# Altium project Audio-Switch-v2.0.PrjPcb (part 3 of 3)

## Sheet Power-Sheet.SchDoc
size 420 x 297 mm; SheetNumber: 2; SheetTotal: 5
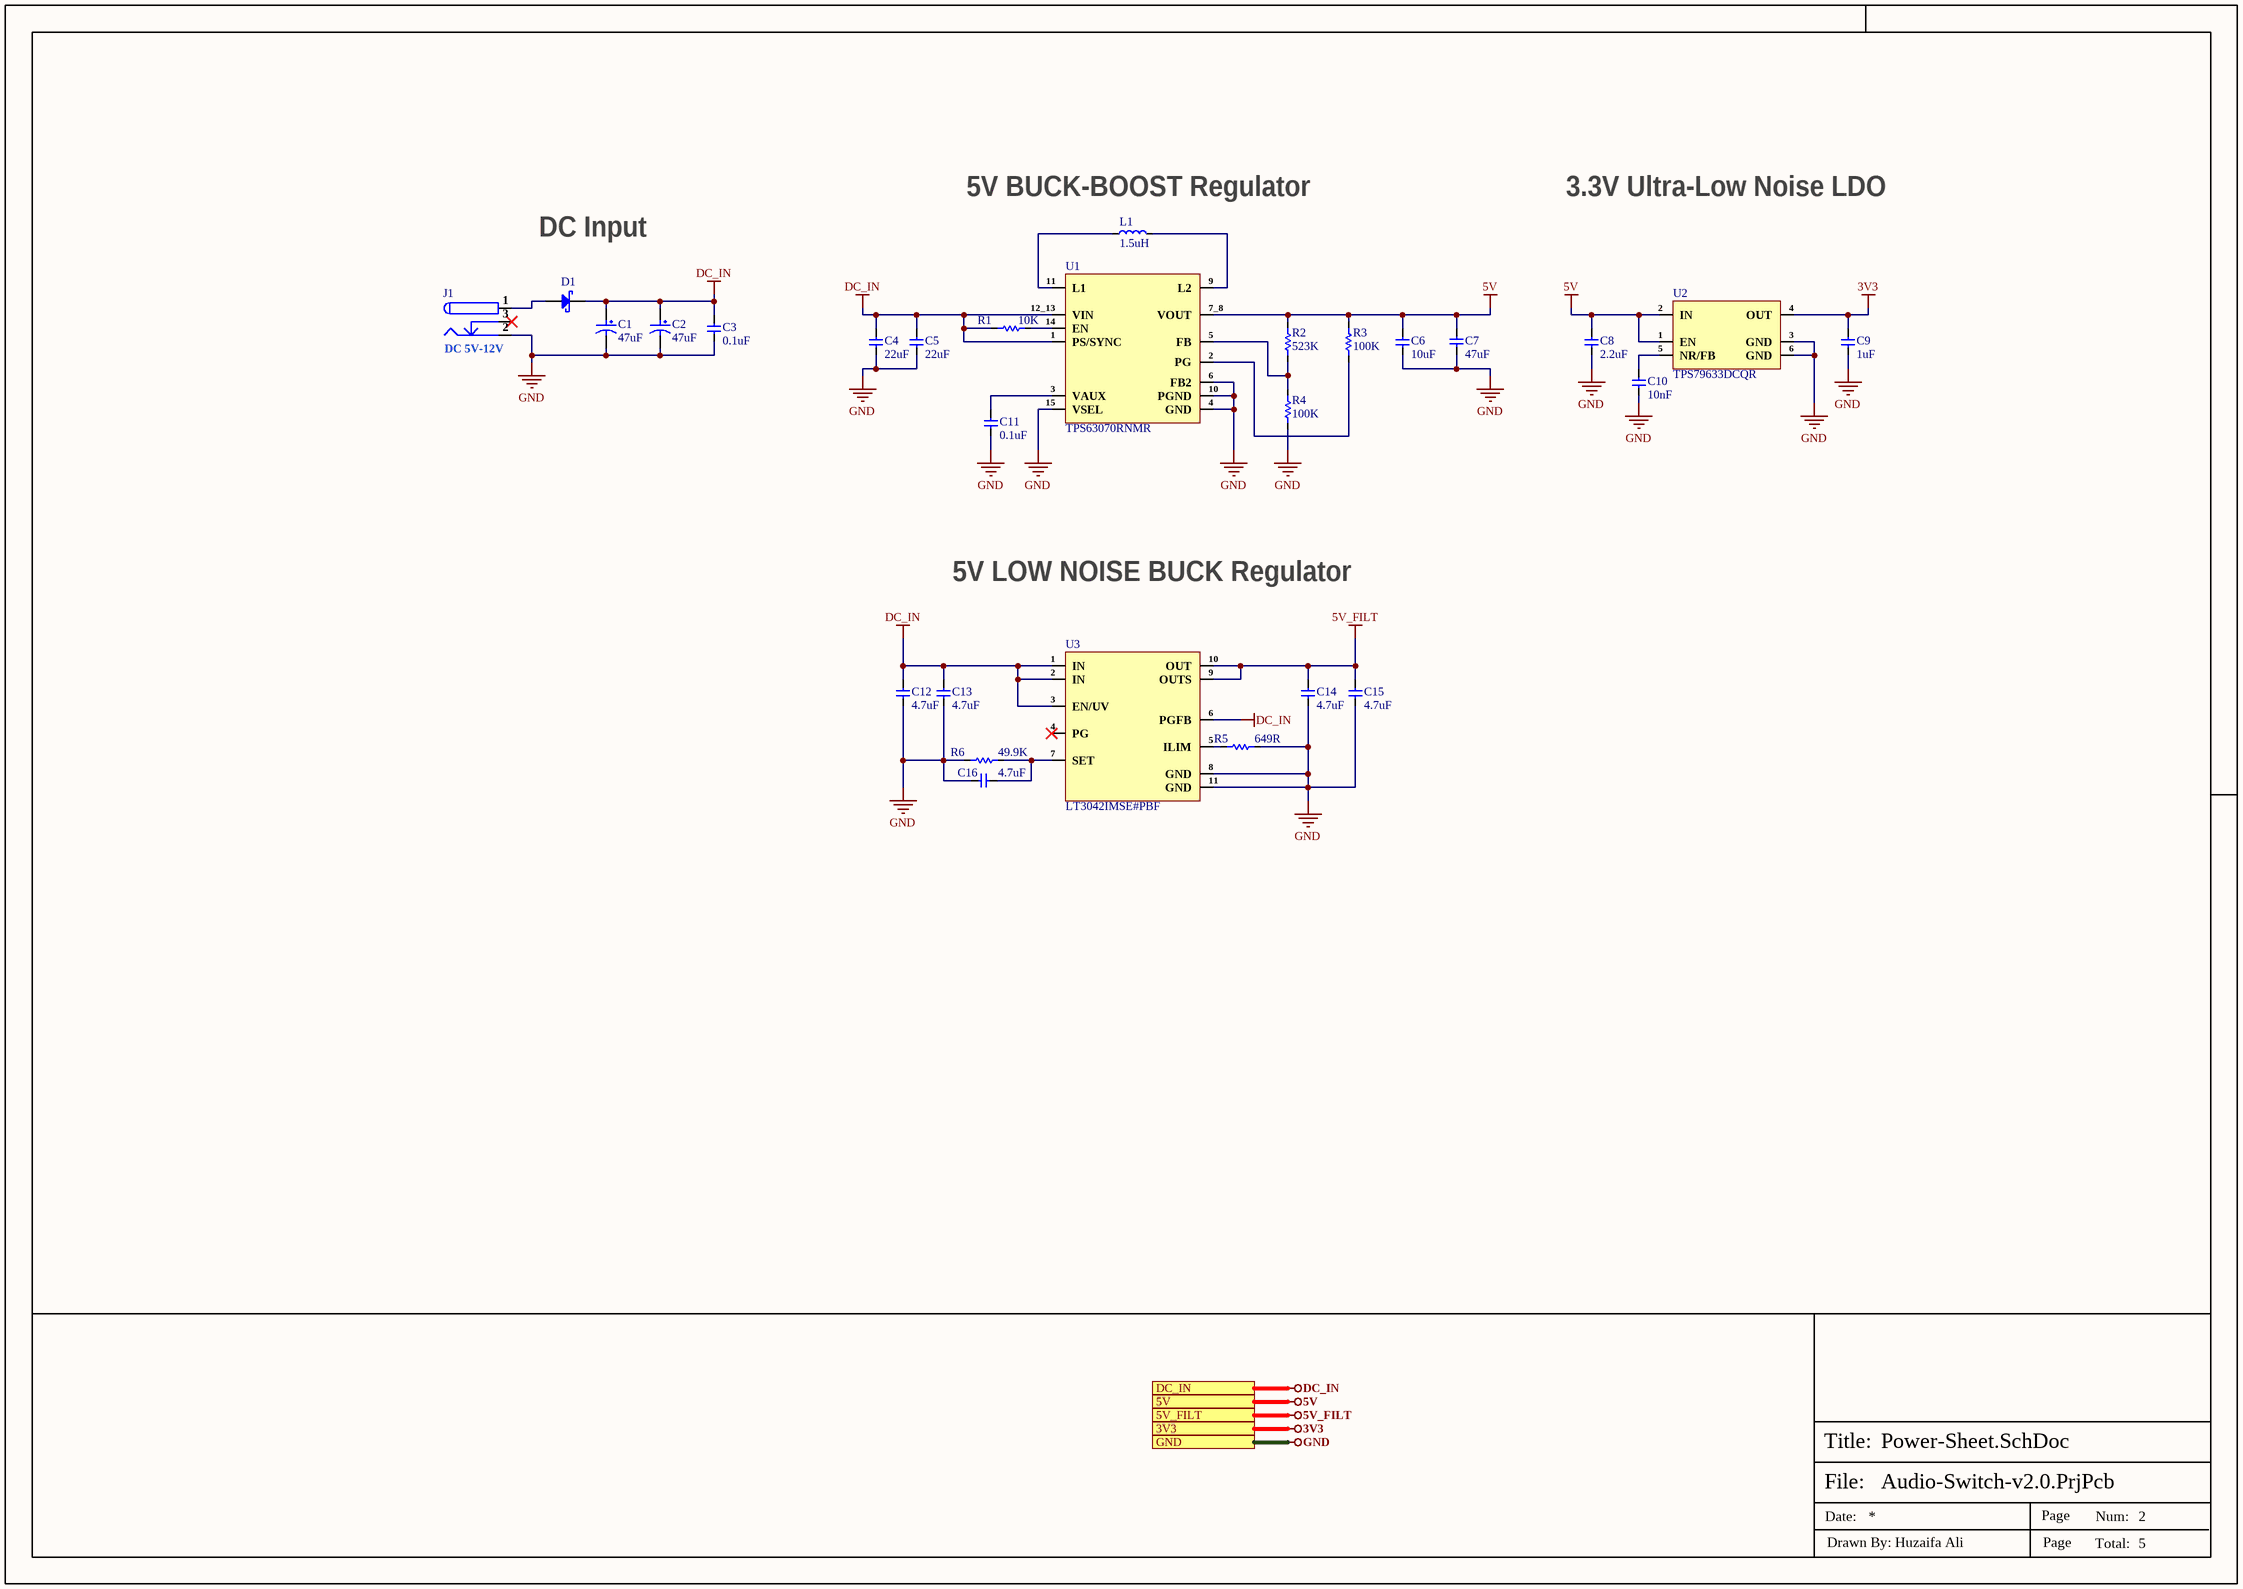
[diagram p3: Power-Sheet.SchDoc]

### Parts
C1  47uF  [25SVPF47M]
C2  47uF  [25SVPF47M]
C3  0.1uF  [Cap-0402]
C4  22uF  [Cap-0805]
C5  22uF  [Cap-0805]
C6  10uF  [Cap-0402]
C7  47uF  [Cap-1210]
C8  2.2uF  [CAP-0603]
C9  1uF  [Cap-0402]
C10  10nF  [Cap-0402]
C11  0.1uF  [Cap-0402]
C12  4.7uF  [Cap-0402]
C13  4.7uF  [Cap-0402]
C14  4.7uF  [Cap-0402]
C15  4.7uF  [Cap-0402]
C16  4.7uF  [Cap-0402]
D1  SS16  [SMA]  (value not drawn)
J1  DC-005-5A-2.5-SMT  [DC-005-5A-2.5-SMT]  (value not drawn)
L1  1.5uH  [LVT303012-1R5M-N]
R1  10K  [Res-0402]
R2  523K  [Res-0603]
R3  100K  [Res-0603]
R4  100K  [Res-0603]
R5  649R  [RES-0805]
R6  49.9K  [Res-0402]
U1  TPS63070RNMR  [VQFN-15-HR(2.5x3)]
U2  TPS79633DCQR  [SOT-223-6_]
U3  LT3042IMSE#PBF  [10-MSOP-EP]

### Ports
3V3 (see Top_Sheet[1B], Controller-Sheet[2D], I2S-to-SPDIF-Sheet[3D], SPDIF-to-I2S-Sheet[3D]), 5V (see Top_Sheet[1A], I2S-to-SPDIF-Sheet[3D], SPDIF-to-I2S-Sheet[3D]), 5V_FILT (see Top_Sheet[1B], I2S-to-SPDIF-Sheet[3D], SPDIF-to-I2S-Sheet[3D]), DC_IN (see Top_Sheet[1A]), GND (see Top_Sheet[1B], Controller-Sheet[2D], I2S-to-SPDIF-Sheet[3D], SPDIF-to-I2S-Sheet[3D])

### Nets
3V3: C9.2 U2.4(OUT) ; port 3V3
5V: C6.2 C7.1 C8.2 R2.2 R3.2 U1.7_8(VOUT) U2.1(EN) U2.2(IN) ; port 5V
5V_FILT: C14.2 C15.2 U3.9(OUTS) U3.10(OUT) ; port 5V_FILT
DC_IN: C1.1 C2.1 C3.2 C4.2 C5.2 C12.2 C13.2 D1.1(K) R1.1 U1.1(PS/SYNC) U1.12_13(VIN) U3.1(IN) U3.2(IN) U3.3(EN/UV) U3.6(PGFB) ; port DC_IN
GND: C1.2 C2.2 C3.1 C4.1 C5.1 C6.1 C7.2 C8.1 C9.1 C10.1 C11.1 C12.1 C13.1 C14.1 C15.1 C16.1 J1.2 R4.1 R5.2 R6.1 U1.4(GND) U1.6(FB2) U1.10(PGND) U1.15(VSEL) U2.3(GND) U2.6(GND) U3.8(GND) U3.11(GND) ; port GND
NetC10_2: C10.2 U2.5(NR/FB)
NetC11_2: C11.2 U1.3(VAUX)
NetC16_2: C16.2 R6.2 U3.7(SET)
NetD1_2: D1.2(A) J1.1
NetL1_1: L1.1 U1.11(L1)
NetL1_2: L1.2 U1.9(L2)
NetR1_2: R1.2 U1.14(EN)
NetR2_1: R2.1 R4.2 U1.5(FB)
NetR3_1: R3.1 U1.2(PG)
NetR5_1: R5.1 U3.5(ILIM)

Not connected (* = marked no-connect by the designer): J1 3*; U3 4(PG)*

### Notes on the sheet
- (near L1) 5V BUCK-BOOST Regulator
- 3.3V Ultra-Low Noise LDO
- DC Input
- (near J1) DC 5V-12V
- 5V LOW NOISE BUCK Regulator
- File:
- Title:
- Date:
- Page
- Num:
- Total:
- Drawn By: Huzaifa Ali

### Library data of the parts
C1 C2 = 25SVPF47M: CAP ALUM POLY 47UF 20% 25V SMD; Manufacturer: Panasonic; Dielectric Material: Aluminium; Polarity: Polarized; ESR (Equivalent Series Resistance): 30mR; Leakage Current: 235uA; Ripple Current: 140mA; Tan Delta: 0.12; Item Type: Capacitor; Supplier 1: Avnet; Manufacturer Part Number: 25SVPF47M; RoHS: Yes; Category: Polymer Capacitors; Stock 1: 1000; Pricing 1: 1000=0.43572, 2000=0.42658, 4000=0.41744, 6000=0.40830, 8000=0.39916 (USD); Mounting Technology: Surface Mount; Pins: 2; Package Shape: Cylindrical; Case/Package: 2626; Min Operating Temperature: -55°C; Max Operating Temperature: 105°C; Value: 47uF; Capacitor Type: Aluminium; Tolerance  (fill in as +-): 20%; Package Style: SMTMeter; Packaging: Tape and Reel; Tolerance (fill in as +-): 20%; Rated DC Voltage (URdc): 25V; Termination: Flat; Length: 7.3mm; Width: 6.6mm; Height: 5.9mm; Reach SVHC Compliant: Yes; RoHS Compliant: Yes; ComponentLink1URL: https://datasheet.ciiva.com:443/pdfs/VipMasterIC/IC/PANA/PANA-S-A0008969958/PANA-S-A0008969958-1.pdf?src-supplier=IHS+Markit; ComponentLink1Description: https://datasheet.ciiva.com:443/pdfs/VipMasterIC/IC/PANA/PANA-S-A0008969958/PANA-S-A0008969958-1.pdf?src-supplier=IHS+Markit; ComponentLink2URL: https://datasheet.ciiva.com/48542/svpf-eng-ds-48542390.pdf?src-supplier=Distrelec; ComponentLink2Description: https://datasheet.ciiva.com/48542/svpf-eng-ds-48542390.pdf?src-supplier=Distrelec; ComponentLink3URL: https://datasheet.ciiva.com/25746/1734360-25746558.pdf?src-supplier=Farnell; ComponentLink3Description: https://datasheet.ciiva.com/25746/1734360-25746558.pdf?src-supplier=Farnell; ComponentLink4URL: https://datasheet.ciiva.com/22746/1734360-22746218.pdf?src-supplier=Element14; ComponentLink4Description: https://datasheet.ciiva.com/22746/1734360-22746218.pdf?src-supplier=Element14; ComponentLink5URL: https://datasheet.ciiva.com/24025/svpf-os-262415-24025725.pdf?src-supplier=Mouser; ComponentLink5Description: https://datasheet.ciiva.com/24025/svpf-os-262415-24025725.pdf?src-supplier=Mouser; Supplier Part Number 1: 25SVPF47M; LCSC Part Number: C136280
C3 C11 = CC0402KRX7R8BB104: CAP CER 0.1UF 25V X7R 0402; Manufacturer: Yageo; Tolerance: 10%; Capacitance: 100nF; Dissipation Factor: 3.5%; Supplier 1: Digi-Key; Manufacturer Part Number: CC0402KRX7R8BB104; RoHS: Yes; Category: Ceramic Capacitors; Stock 1: 1841009; Pricing 1: 1=0.10000, 10=0.03100, 50=0.01700, 100=0.01390, 500=0.00990, 1000=0.00777, 2500=0.00707, 5000=0.00650 (USD); Mount: Surface Mount; Case/Package: 0402; Case Code (Imperial): 0402; Case Code (Metric): 1005; Min Operating Temperature: -55°C; Max Operating Temperature: 125°C; Dielectric: X7R; Voltage Rating: 25V; Voltage Rating (DC): 25V; Packaging: Tape and Reel; Termination: SMD/SMT; Resistor Type: Ceramic; Length: 1mm; Width: 0.02inch; Height: 0.5mm; Thickness: 0.022inch; Depth: 0.5mm; Radiation Hardening: No; Lead Free: Lead Free; Halogen Free: Halogen Free; ComponentLink1URL: https://datasheet.ciiva.com/11464/upy-gphc-x7r-6-3v-to-50v-8-11464889.pdf?src-supplier=Avnet; ComponentLink1Description: https://datasheet.ciiva.com/11464/upy-gphc-x7r-6-3v-to-50v-8-11464889.pdf?src-supplier=Avnet; ComponentLink2URL: https://datasheet.ciiva.com/13210/upy-gphc-x7r-6-3v-to-50v-8-12304-13210908.pdf?src-supplier=Mouser; ComponentLink2Description: https://datasheet.ciiva.com/13210/upy-gphc-x7r-6-3v-to-50v-8-12304-13210908.pdf?src-supplier=Mouser; ComponentLink3URL: https://datasheet.ciiva.com/17437/upy-gphc-x7r-6-3v-to-50v-8-17437357.pdf?src-supplier=Avnet+Europe; ComponentLink3Description: https://datasheet.ciiva.com/17437/upy-gphc-x7r-6-3v-to-50v-8-17437357.pdf?src-supplier=Avnet+Europe; Supplier Part Number 1: 311-2077-1-ND; LCSC Part Number: C105883
C4 C5 = CL21A226MAYNNNE: CAP CER 22UF 25V X5R 0805; Manufacturer: Samsung; Supplier 1: Mouser; Manufacturer Part Number: CL21A226MAYNNNE; RoHS: Yes; Category: Ceramic Capacitors; Stock 1: 1240410; Pricing 1: 1=0.28000, 10=0.18500, 50=0.18500, 100=0.10600, 500=0.07500, 1000=0.06400, 2000=0.06100, 10000=0.05400, 24000=0.05100, 50000=0.04600 (USD); RoHS Compliant: Yes; Supplier Part Number 1: 187-CL21A226MAYNNNE; LCSC Part Number: C602037
C6 = CL05A106MP5NUNC: CAP CER 10UF 10V X5R 0402; Manufacturer: Samsung; Tolerance: 20%; Item Type: Capacitor; Supplier 1: Avnet; Manufacturer Part Number: CL05A106MP5NUNC; RoHS: Yes; Category: Ceramic Capacitors; Stock 1: 1729850; Pricing 1: 10000=0.02537 (USD); Mount: Surface Mount; Case/Package: 0402; Case Code (Metric): 1005; Case Code (Imperial): 0402; Contact Plating: Tin; Min Operating Temperature: -55°C; Max Operating Temperature: 85°C; Package Quantity: 1; Packaging: Tape and Reel; Capacitance: 10uF; Voltage Rating: 10V; Dielectric: X5R; Termination: Wraparound; Series: CL; Construction: Flat; Length: 1mm; Width: 0.02inch; Thickness: 0.028inch; Depth: 0.5mm; Radiation Hardening: No; Lead Free: Lead Free; RoHS Compliant: Yes; ComponentLink1URL: https://datasheet.ciiva.com/25721/cl05a106mp5nunc-25721584.pdf?src-supplier=Digi-Key; ComponentLink1Description: https://datasheet.ciiva.com/25721/cl05a106mp5nunc-25721584.pdf?src-supplier=Digi-Key; ComponentLink2URL: https://datasheet.ciiva.com/26838/getdatasheetpartid-745310-26838170.pdf?src-supplier=Verical; ComponentLink2Description: https://datasheet.ciiva.com/26838/getdatasheetpartid-745310-26838170.pdf?src-supplier=Verical; Supplier Part Number 1: CL05A106MP5NUNC; LCSC Part Number: C315248
C7 = TMK325ABJ476MM-P: CAP CER 47uF 25V 1210; Manufacturer: Taiyo Yuden; Dielectric: X5R; Tolerance: 20%; Supplier 1: RSComponents; Manufacturer Part Number: TMK325ABJ476MM-P; RoHS: Yes; Category: Ceramic Capacitors; Stock 1: 1000; Pricing 1: 1000=0.37500 (GBP); Mount: Surface Mount; Case/Package: Ceramic; Contact Plating: Tin; Min Operating Temperature: -55°C; Max Operating Temperature: 85°C; Capacitance: 47uF; Termination: Wraparound; Packaging: Tape and Reel; Length: 3.2mm; Lead Free: Lead Free; RoHS Compliant: Yes; ComponentLink1URL: http://www.yuden.co.jp/productdata/catalog/en/mlcc_all_e.pdf?src-supplier=Avnet+Asia; ComponentLink1Description: http://www.yuden.co.jp/productdata/catalog/en/mlcc_all_e.pdf?src-supplier=Avnet+Asia; ComponentLink2URL: http://ds.yuden.co.jp/TYCOMPAS/ut/detail.do?productNo=TMK325ABJ476MM-P&fileName=TMK325ABJ476MM-P_SS&mode=specSheetDownload&src-supplier=Digi-Key; ComponentLink2Description: http://ds.yuden.co.jp/TYCOMPAS/ut/detail.do?productNo=TMK325ABJ476MM-P&fileName=TMK325ABJ476MM-P_SS&mode=specSheetDownload&src-supplier=Digi-Key; ComponentLink3URL: https://ds.yuden.co.jp/TYCOMPAS/ut/detail?pn=TMK325ABJ476MM-P &amp;u=M&src-supplier=Digi-Key; ComponentLink3Description: https://ds.yuden.co.jp/TYCOMPAS/ut/detail?pn=TMK325ABJ476MM-P &amp;u=M&src-supplier=Digi-Key; Supplier Part Number 1: 1782936; LCSC Part Number: C90142
C8 = CC0603KRX5R8BB225: CAP CER 2.2UF 25V X5R 0603; Manufacturer: Yageo; Tolerance: 10%; Item Type: Capacitor; Supplier 1: Digi-Key; Manufacturer Part Number: CC0603KRX5R8BB225; Stock 1: 687936; Pricing 1: 1=0.4, 10=0.276, 50=0.1932, 100=0.1656, 500=0.1242, 1000=0.10488 (USD); Mount: Surface Mount; Case/Package: 0603; Case Code (Metric): 1608; Case Code (Imperial): 0603; Weight: 7.1E-05oz; Min Operating Temperature: -55°C; Max Operating Temperature: 85°C; Packaging: Tape and Reel; Capacitance: 2.2uF; Dielectric: X5R; Voltage Rating: 25V; Termination: SMD/SMT; Resistor Type: Ceramic; Voltage Rating (DC): 25V; Package Quantity: 4000; Length: 1.6mm; Width: 0.031inch; Thickness: 0.037inch; Depth: 0.8mm; Radiation Hardening: No; Lead Free: Lead Free; Halogen Free: Halogen Free; RoHS Compliant: Yes; ComponentLink1URL: https://www.verical.com/server-webapp/html/getDatasheet?partID=782757&src-supplier=Verical; ComponentLink1Description: https://www.verical.com/server-webapp/html/getDatasheet?partID=782757&src-supplier=Verical; Supplier Part Number 1: 311-1786-1-ND; LCSC Part Number: C309478
C9 = CC0402KRX5R7BB105: CAP CER 1UF 16V X5R 0402; Manufacturer: Yageo; Tolerance: 10%; Item Type: Capacitor; Supplier 1: Digi-Key; Manufacturer Part Number: CC0402KRX5R7BB105; Stock 1: 1405667; Pricing 1: 1=0.36, 10=0.252, 100=0.1512, 500=0.1134, 1000=0.09576, 2500=0.09072, 5000=0.08568 (USD); Mount: Surface Mount; Case/Package: 0402; Weight: 2.3E-05oz; Case Code (Imperial): 0402; Case Code (Metric): 1005; Min Operating Temperature: -55°C; Max Operating Temperature: 85°C; Capacitance: 1uF; Dielectric: X5R; Packaging: Tape and Reel; Voltage Rating (DC): 16V; Voltage Rating: 16V; Termination: SMD/SMT; Composition: Ceramic; Length: 1mm; Height: 0.5mm; Width: 0.02inch; Thickness: 0.022inch; Depth: 0.5mm; Radiation Hardening: No; Lead Free: Lead Free; Halogen Free: Halogen Free; ComponentLink1URL: http://www.yageo.com/documents/recent/UPY-GPHC_X5R_4V-to-50V_12.pdf?src-supplier=Avnet+Europe; ComponentLink1Description: http://www.yageo.com/documents/recent/UPY-GPHC_X5R_4V-to-50V_12.pdf?src-supplier=Avnet+Europe; Supplier Part Number 1: 311-1691-6-ND; LCSC Part Number: C325464
C10 = CC0402KRX7R8BB103: CAP CER 10000PF 25V X7R 0402; Manufacturer: Yageo; Tolerance: 10%; Item Type: Capacitor; Supplier 1: Digi-Key; Manufacturer Part Number: CC0402KRX7R8BB103; Stock 1: 0; Pricing 1: 1=0.1, 10=0.021, 100=0.0093, 500=0.00666, 1000=0.00523, 2500=0.00476, 5000=0.00438 (USD); Mount: Surface Mount; Case/Package: 0402; Case Code (Metric): 1005; Case Code (Imperial): 0402; Min Operating Temperature: -55°C; Max Operating Temperature: 125°C; Capacitance: 10nF; Dielectric: X7R; Voltage Rating: 25V; Package Quantity: 1; Packaging: Tape and Reel; Voltage Rating (DC): 25V; Termination: SMD/SMT; Composition: Ceramic; Length: 1mm; Height: 0.5mm; Depth: 0.5mm; Width: 0.02inch; Thickness: 0.022inch; Radiation Hardening: No; REACH SVHC: Unknown; Lead Free: Lead Free; Halogen Free: Halogen Free; ComponentLink1URL: http://www.yageo.com/documents/recent/UPY-GPHC_X7R_6.3V-to-50V_18.pdf?src-supplier=Digi-Key; ComponentLink1Description: http://www.yageo.com/documents/recent/UPY-GPHC_X7R_6.3V-to-50V_18.pdf?src-supplier=Digi-Key; ComponentLink2URL: https://www.verical.com/server-webapp/html/getDatasheet?partID=375418&src-supplier=Verical; ComponentLink2Description: https://www.verical.com/server-webapp/html/getDatasheet?partID=375418&src-supplier=Verical; ComponentLink3URL: http://www.yageo.com/documents/recent/UPY-GPHC_X7R_6.3V-to-50V_8.pdf?src-supplier=Avnet; ComponentLink3Description: http://www.yageo.com/documents/recent/UPY-GPHC_X7R_6.3V-to-50V_8.pdf?src-supplier=Avnet; ComponentLink4URL: https://4donline.ihs.com/images/VipMasterIC/IC/YAGO/YAGO-S-A0003557223/YAGO-S-A0003557223-1.pdf?hkey=52A5661711E402568146F3353EA87419&src-supplier=Element14; ComponentLink4Description: https://4donline.ihs.com/images/VipMasterIC/IC/YAGO/YAGO-S-A0003557223/YAGO-S-A0003557223-1.pdf?hkey=52A5661711E402568146F3353EA87419&src-supplier=Element14; ComponentLink5URL: http://www.farnell.com/datasheets/2167236.pdf?src-supplier=Element14; ComponentLink5Description: http://www.farnell.com/datasheets/2167236.pdf?src-supplier=Element14; ComponentLink6URL: http://www.mouser.com/ds/2/447/Yageo_UPY-GP_NP0_16V-to-50V_9-358835.pdf?src-supplier=Mouser; ComponentLink6Description: http://www.mouser.com/ds/2/447/Yageo_UPY-GP_NP0_16V-to-50V_9-358835.pdf?src-supplier=Mouser; Supplier Part Number 1: 311-1337-1-ND; LCSC Part Number: C327025
C12-C16 = CL05A475MO5NUNC: CAP CER 4.7UF 16V X5R 0402; Manufacturer: Samsung; Material: 4241ConductorMaterial; Tolerance: 20%; Supplier 1: Avnet; Manufacturer Part Number: CL05A475MO5NUNC; RoHS: Yes; Category: Ceramic Capacitors; Stock 1: 50000; Pricing 1: 10000=0.09712 (USD); Mount: Surface Mount; Case/Package: 0402; Case Code (Metric): 1005; Case Code (Imperial): 0402; Min Operating Temperature: -55°C; Max Operating Temperature: 85°C; Packaging: Cut Tape; Capacitance: 4.7uF; Voltage Rating: 16V; Series: CL; Voltage Rating (DC): 16V; Length: 0.039inch; Width: 0.02inch; Height: 550um; Thickness: 0.022inch; RoHS Compliant: Yes; ComponentLink1URL: http://www.farnell.com/datasheets/2710653.pdf?src-supplier=Farnell; ComponentLink1Description: http://www.farnell.com/datasheets/2710653.pdf?src-supplier=Farnell; ComponentLink2URL: http://www.samsungsem.com/kr/support/product-search/mlcc/CL05A475MO5NUNC.jsp?src-supplier=Digikey; ComponentLink2Description: http://www.samsungsem.com/kr/support/product-search/mlcc/CL05A475MO5NUNC.jsp?src-supplier=Digikey; ComponentLink3URL: http://www.farnell.com/datasheets/2710653.pdf?src-supplier=Element14; ComponentLink3Description: http://www.farnell.com/datasheets/2710653.pdf?src-supplier=Element14; ComponentLink4URL: https://datasheet.octopart.com/CL05A475MO5NUNC-Samsung-Electro-Mechanics-datasheet-123102911.pdf?src-supplier=Future+Electronics; ComponentLink4Description: https://datasheet.octopart.com/CL05A475MO5NUNC-Samsung-Electro-Mechanics-datasheet-123102911.pdf?src-supplier=Future+Electronics; ComponentLink5URL: http://www.farnell.com/datasheets/2710653.pdf?src-supplier=Newark; ComponentLink5Description: http://www.farnell.com/datasheets/2710653.pdf?src-supplier=Newark; Supplier Part Number 1: CL05A475MO5NUNC
D1 = SS16: 60V 700mV@1A 1A SMA(DO-214AC) Schottky Barrier Diodes (SBD) ROHS; Manufacturer: MDD; Item Type: Schottky Diode; Manufacturer Part Number: SS16; Package: SMA(DO-214AC); LCSC Part Number: C2481; ComponentLink1Description: LCSC; ComponentLink1URL: https://www.lcsc.com/product-detail/Schottky-Barrier-Diodes-SBD_MDD-Microdiode-Electronics-SS16_C2481.html
J1 = DC-005-5A-2.5-SMT: DC Power Receptacle Jack 2.5A 2.5mm 6.5mm SMD Power Connectors RoHS; Manufacturer: XKB Enterprise; Value: Custom; Manufacturer Part Number: DC-005-5A-2.5-SMT; Package: Custom; ComponentLink1Description: LCSC; ComponentLink1URL: https://www.lcsc.com/product-detail/AC-DC-Power-Connectors_XKB-Connectivity-DC-005-5A-2-5-SMT_C319133.html; LCSC Part Number: C319133
L1 = LVT303012-1R5M-N: 2.34A 1.5uH Shielded Power Inductors ±20% SMD Power Inductors ROHS; Manufacturer: Chilisin Elec; Manufacturer Part Number: LVT303012-1R5M-N; Package: SMD; LCSC Part Number: C280560; Item Type: Inductor; ComponentLink1Description: LCSC; ComponentLink1URL: https://www.lcsc.com/product-detail/Power-Inductors_Chilisin-Elec-LVT303012-1R5M-N_C280560.html
R1 = RC0402FR-0710KL: RES 10K OHM 1% 1/16W 0402; Manufacturer: Yageo; Resistance: 10kR; Voltage Rating (DC): 50V; Temperature Coefficient: 100ppm/°C; Power Rating: 62.5mW; Max Power Dissipation: 63mW; Item Type: Resistor; Supplier 1: Mouser; Manufacturer Part Number: RC0402FR-0710KL; RoHS: Yes; Category: Chip SMD Resistors; Stock 1: 18648329; Pricing 1: 1=0.10000, 10=0.01400, 50=0.01400, 100=0.00500, 1000=0.00300, 10000=0.00200 (USD); Case/Package: 0402; Number of Pins: 2; Case Code (Imperial): 0402; Case Code (Metric): 1005; Min Operating Temperature: -55°C; Max Operating Temperature: 155°C; Resistor Type: Thick Film; Tolerance: 1%; Packaging: Tape and Reel; Voltage Rating: 50V; Termination: SMD/SMT; Working Voltage: 50V; Number of Terminations: 2; Features: Moisture Resistant; Series: RC; Resistance Tolerance: 1%; Construction: Rectangular; Length: 1mm; Width: 0.5mm; Height: 0.32mm; Depth: 0.5mm; Lead Pitch: 0.2mm; REACH SVHC: No SVHC; Lead Free: Lead Free; RoHS Compliant: Yes; Military Standard: Not; ComponentLink1URL: https://datasheet.ciiva.com/7660/38568-7660787.pdf?src-supplier=Element14; ComponentLink1Description: https://datasheet.ciiva.com/7660/38568-7660787.pdf?src-supplier=Element14; ComponentLink2URL: https://datasheet.ciiva.com/7849/1686128-7849814.pdf?src-supplier=Element14; ComponentLink2Description: https://datasheet.ciiva.com/7849/1686128-7849814.pdf?src-supplier=Element14; ComponentLink3URL: https://datasheet.ciiva.com/7983/1018594-7983486.pdf?src-supplier=Element14; ComponentLink3Description: https://datasheet.ciiva.com/7983/1018594-7983486.pdf?src-supplier=Element14; ComponentLink4URL: https://datasheet.ciiva.com/22747/1018594-22747512.pdf?src-supplier=Element14; ComponentLink4Description: https://datasheet.ciiva.com/22747/1018594-22747512.pdf?src-supplier=Element14; ComponentLink5URL: https://datasheet.ciiva.com/12667/pyu-rc0402-51-rohs-l-6-r-12667067.pdf?src-supplier=Mouser; ComponentLink5Description: https://datasheet.ciiva.com/12667/pyu-rc0402-51-rohs-l-6-r-12667067.pdf?src-supplier=Mouser; ComponentLink6URL: https://datasheet.ciiva.com/7849/1784430-7849813.pdf?src-supplier=Element14; ComponentLink6Description: https://datasheet.ciiva.com/7849/1784430-7849813.pdf?src-supplier=Element14; ComponentLink7URL: https://datasheet.ciiva.com/7849/1784430-7849815.pdf?src-supplier=Element14; ComponentLink7Description: https://datasheet.ciiva.com/7849/1784430-7849815.pdf?src-supplier=Element14; Supplier Part Number 1: 603-RC0402FR-0710KL; LCSC Part Number: C60490
R2 = RT0603BRD07523KL: RES SMD 523K OHM 0.1% 1/10W 0603; Manufacturer: Yageo; Item Type: Resistor; Value: 523kR; Power Rating: 100mW; Voltage Rating: 75V; Temperature Coefficient: 25ppm/°C; Supplier: Digikey; Supplier Part Number: 13-RT0603BRD07523KLCT-ND; Manufacturer Part Number: RT0603BRD07523KL; RoHS: Yes; Pricing: 1=0.13, 10=0.102, 50=0.081, 100=0.0728, 500=0.0558, 1000=0.04943 (USD); Case/Package: 0603; Case Code (Imperial): 0603; Case Code (Metric): 1608; Weight: 7.1E-05oz; Min Operating Temperature: -55°C; Max Operating Temperature: 155°C; Packaging: Tape and Reel; Tolerance: 0.1%; Termination: SMD/SMT; Number of Terminations: 2; Max Power Dissipation: 100mW; Features: Moisture Resistant; Series: RT; Length: 0.063inch; Width: 0.8mm; Height: 0.022inch; RoHS Compliant: Yes; ComponentLink1URL: https://datasheet.ciiva.com/12812/pyu-rt-1-to-0-05-rohs-l-4-12812552.pdf?src-supplier=Mouser; ComponentLink1Description: https://datasheet.ciiva.com/12812/pyu-rt-1-to-0-05-rohs-l-4-12812552.pdf?src-supplier=Mouser; LCSC Part Number: C861460
R3 R4 = RT0603BRD07100KL: RES SMD 100K OHM 0.1% 1/10W 0603; Manufacturer: Yageo; Resistance: 100kR; Temperature Coefficient: 25ppm/°C; Voltage Rating (DC): 75V; Power Rating: 100mW; Item Type: Resistor; Supplier 1: Digi-Key; Manufacturer Part Number: RT0603BRD07100KL; Stock 1: 53395; Pricing 1: 1=0.39, 10=0.332, 100=0.1298, 1000=0.05435, 2500=0.04982 (USD); Mount: Surface Mount; Case/Package: 0603; Case Code (Imperial): 0603; Case Code (Metric): 1608; Min Operating Temperature: -55°C; Max Operating Temperature: 125°C; Tolerance: 0.1%; Composition: Thin Film; Packaging: Tape and Reel; Voltage Rating: 75V; Package Quantity: 5000; Termination: SMD/SMT; Number of Terminations: 2; Military Standard: Not; Max Power Dissipation: 100mW; Working Voltage: 75V; Features: Moisture Resistant; Length: 1.6mm; Height: 0.022inch; Width: 0.031inch; Depth: 0.8mm; Lead Free: Lead Free; ComponentLink1URL: http://documents.rs-components.com/techlib://itc_doclist_GB.htm?stockno=6174810&src-supplier=RSComponents; ComponentLink1Description: http://documents.rs-components.com/techlib://itc_doclist_GB.htm?stockno=6174810&src-supplier=RSComponents; Supplier Part Number 1: YAG1235CT-ND; LCSC Part Number: C122538
R5 = RT0805BRD07649RL: RES SMD 649 OHM 0.1% 1/8W 0805; Manufacturer: Yageo; Power Rating: 125mW; Voltage Rating: 150V; Temperature Coefficient: 25ppm/°C; Item Type: Resistor; Supplier 1: Digi-Key; Manufacturer Part Number: RT0805BRD07649RL; RoHS: Yes; Category: Chip SMD Resistors; Stock 1: 6872; Pricing 1: 1=0.38000, 10=0.27200, 100=0.10870, 500=0.07404, 1000=0.05357, 2500=0.04963 (USD); Case/Package: 0805; Case Code (Metric): 2012; Case Code (Imperial): 0805; Contact Plating: Tin,Matte; Min Operating Temperature: -55°C; Max Operating Temperature: 125°C; Resistance: 649R; Tolerance: 0.1%; Package Quantity: 5000; Packaging: Tape and Reel; Resistor Type: Thin Film; Number of Terminations: 2; Termination: SMD/SMT; Max Power Dissipation: 125mW; Voltage Rating (DC): 150V; Series: RT; Length: 0.079inch; Width: 0.049inch; Height: 0.024inch; Radiation Hardening: No; Lead Free: Lead Free; RoHS Compliant: Yes; ComponentLink1URL: https://datasheet.ciiva.com/2585/pyu-rt-1-to-0-05-rohs-l-5-2585132.pdf?src-supplier=Digi-Key; ComponentLink1Description: https://datasheet.ciiva.com/2585/pyu-rt-1-to-0-05-rohs-l-5-2585132.pdf?src-supplier=Digi-Key; ComponentLink2URL: https://datasheet.ciiva.com/12704/pyu-rt-1-to-0-05-rohs-l-4-12704493.pdf?src-supplier=Mouser; ComponentLink2Description: https://datasheet.ciiva.com/12704/pyu-rt-1-to-0-05-rohs-l-4-12704493.pdf?src-supplier=Mouser; Supplier Part Number 1: YAG4930CT-ND; LCSC Part Number: C865602
R6 = RC0402FR-0749K9L: RES 49.9K OHM 1% 1/16W 0402; Manufacturer: Yageo; Power Rating: 62.5mW; Value: 49.9kR; Voltage Rating: 50V; Temperature Coefficient: 100ppm/°C; Max Power Dissipation: 63mW; Item Type: Resistor; Supplier: Digikey; Supplier Part Number: 311-49.9KLRCT-ND; Manufacturer Part Number: RC0402FR-0749K9L; RoHS: Yes; Category: Chip SMD Resistors; Stock: 5084418; Pricing: 1=0.1, 10=0.015, 50=0.0088, 100=0.0073, 500=0.00488, 1000=0.00417, 5000=0.00297 (USD); Case/Package: 0402; Case Code (Imperial): 0402; Case Code (Metric): 1005; Min Operating Temperature: -55°C; Max Operating Temperature: 155°C; Tolerance: 1%; Packaging: Tape and Reel; Termination: SMD/SMT; Voltage Rating (DC): 50V; Features: Moisture Resistant; Series: RC; Number of Terminations: 2; Construction: Rectangular; Length: 1mm; Depth: 0.5mm; RoHS Compliant: Yes; Military Standard: Not; Lead Free: Lead Free; ComponentLink1URL: https://datasheet.ciiva.com/17071/pyu-rc0402-51-rohs-l-6-r-17071066.pdf?src-supplier=Future+Electronics; ComponentLink1Description: https://datasheet.ciiva.com/17071/pyu-rc0402-51-rohs-l-6-r-17071066.pdf?src-supplier=Future+Electronics; LCSC Part Number: C137969
U1 = TPS63070RNMR: IC REG BCK BST ADJ 3.6A 15VQFN; Manufacturer: Texas Instruments; Supplier: Mouser; Supplier Part Number: 595-TPS63070RNMR; Manufacturer Part Number: TPS63070RNMR; RoHS: Yes; Category: Voltage Regulators - Switching; Stock: 55982; Pricing: 1=2.7, 10=2.29, 50=2.29, 100=1.99, 1000=1.43, 10000=1.21 (USD); ComponentLink1URL: http://www.ti.com/lit/ds/symlink/tps63070.pdf?src-supplier=Digi-Key; ComponentLink1Description: http://www.ti.com/lit/ds/symlink/tps63070.pdf?src-supplier=Digi-Key; ComponentLink2URL: http://www.ti.com/lit/ds/symlink/tps63070.pdf?src-supplier=Farnell; ComponentLink2Description: http://www.ti.com/lit/ds/symlink/tps63070.pdf?src-supplier=Farnell; LCSC Part Number: C109322; Item Type: IC
U2 = TPS79633DCQR: IC REG LINEAR 3.3V 1A SOT223-6; Manufacturer: Texas Instruments; Supplier: Mouser; Supplier Part Number: 595-TPS79633DCQR; Manufacturer Part Number: TPS79633DCQR; RoHS: Yes; Category: Voltage Regulators - Linear; Stock: 3089; Pricing: 1=3.24, 10=2.75, 50=2.75, 100=2.39, 1000=1.72, 10000=1.56 (USD); Length: 6.5mm; Width: 3.5mm; Thickness: 1.6mm; ComponentLink1URL: https://datasheet.ciiva.com/2045/tps79601-2045264.pdf?src-supplier=Digi-Key; ComponentLink1Description: https://datasheet.ciiva.com/2045/tps79601-2045264.pdf?src-supplier=Digi-Key; ComponentLink2URL: https://datasheet.ciiva.com/22704/1846966-22704703.pdf?src-supplier=Element14; ComponentLink2Description: https://datasheet.ciiva.com/22704/1846966-22704703.pdf?src-supplier=Element14; ComponentLink3URL: https://datasheet.ciiva.com/41462/001015136-da-01-en-ic-reg-ldo-3-3v-1-tps79633dcqr-sot-6-tid-41462982.pdf?src-supplier=Conrad; ComponentLink3Description: https://datasheet.ciiva.com/41462/001015136-da-01-en-ic-reg-ldo-3-3v-1-tps79633dcqr-sot-6-tid-41462982.pdf?src-supplier=Conrad; LCSC Part Number: C485803; Item Type: IC
U3 = LT3042IMSE#PBF: IC REG LIN POS ADJ 200MA 10MSOP; Manufacturer: Analog Devices / Linear Technology; Supplier: Mouser; Supplier Part Number: 584-LT3042IMSE#PBF; Manufacturer Part Number: LT3042IMSE#PBF; RoHS: Yes; Item Type: IC; Stock: 18453; Pricing: 1=6.55, 10=5.91, 50=5.75, 100=5.09, 1000=4.11, 10000=4.11 (USD); ComponentLink1URL: http://www.farnell.com/datasheets/1941078.pdf?src-supplier=Farnell; ComponentLink1Description: http://www.farnell.com/datasheets/1941078.pdf?src-supplier=Farnell; ComponentLink2URL: https://datasheet.octopart.com/LT3042IMSE%23PBF-Linear-Technology-datasheet-41232635.pdf?src-supplier=Farnell; ComponentLink2Description: https://datasheet.octopart.com/LT3042IMSE%23PBF-Linear-Technology-datasheet-41232635.pdf?src-supplier=Farnell; ComponentLink3URL: https://datasheet.octopart.com/LT3042IMSE%23PBF-Analog-Devices-datasheet-138896359.pdf?src-supplier=Element14; ComponentLink3Description: https://datasheet.octopart.com/LT3042IMSE%23PBF-Analog-Devices-datasheet-138896359.pdf?src-supplier=Element14; ComponentLink4URL: http://www.linear.com/docs/55649?src-supplier=Digikey; ComponentLink4Description: http://www.linear.com/docs/55649?src-supplier=Digikey

## Sheet SPDIF-to-I2S-Sheet.SchDoc
size 420 x 297 mm; SheetNumber: 3; SheetTotal: 5
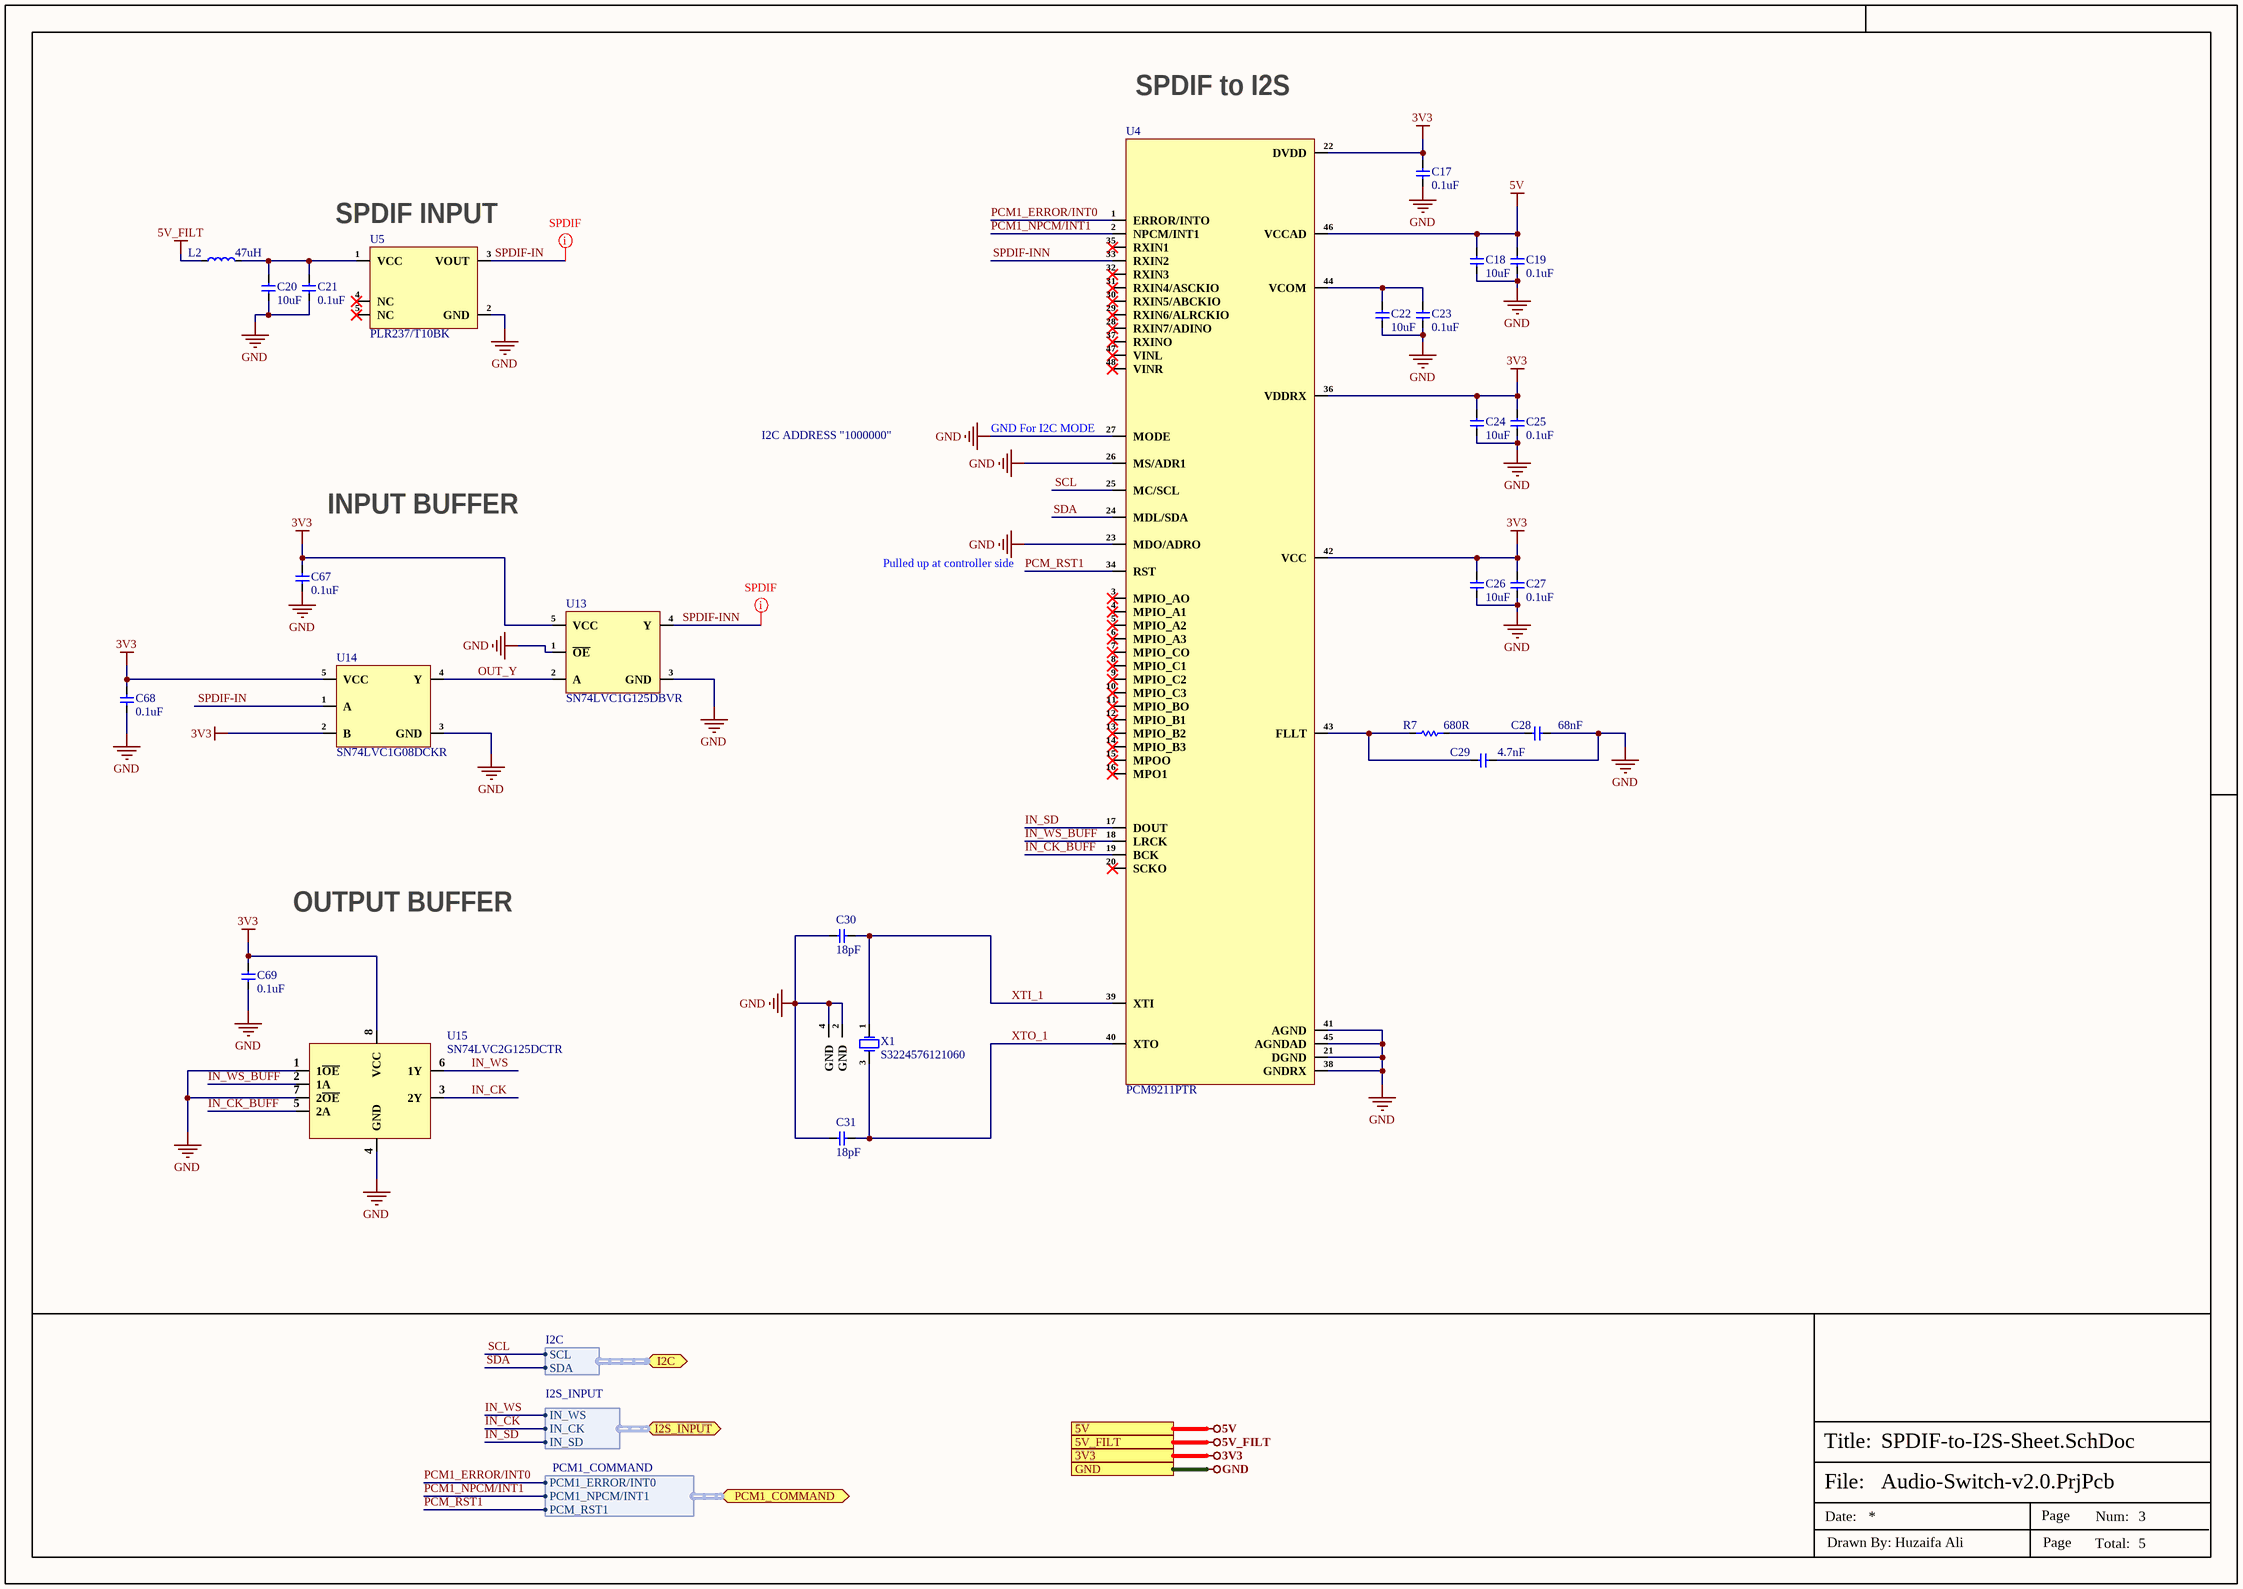
[diagram p4: SPDIF-to-I2S-Sheet.SchDoc]

### Parts
C17  0.1uF  [Cap-0402]
C18  10uF  [Cap-0402]
C19  0.1uF  [Cap-0402]
C20  10uF  [Cap-0402]
C21  0.1uF  [Cap-0402]
C22  10uF  [Cap-0402]
C23  0.1uF  [Cap-0402]
C24  10uF  [Cap-0402]
C25  0.1uF  [Cap-0402]
C26  10uF  [Cap-0402]
C27  0.1uF  [Cap-0402]
C28  68nF  [Cap-0402]
C29  4.7nF  [Cap-0402]
C30  18pF  [Cap-0402]
C31  18pF  [Cap-0402]
C67  0.1uF  [Cap-0402]
C68  0.1uF  [Cap-0402]
C69  0.1uF  [Cap-0402]
L2  47uH  [Ind-0805]
R7  680R  [Res-0402]
U4  PCM9211PTR  [48-LQFP (7x7)]
U5  PLR237/T10BK  [PLR237/T10BK]
U13  SN74LVC1G125DBVR  [SOT-23-5]
U14  SN74LVC1G08DCKR  [SC70-5]
U15  SN74LVC2G125DCTR  [SM8]
X1  S3224576121060  [S3224576121060_]

### Ports
3V3 (see Top_Sheet[2B], Controller-Sheet[2D], I2S-to-SPDIF-Sheet[3D], Power-Sheet[4D]), 5V (see Top_Sheet[2A], I2S-to-SPDIF-Sheet[3D], Power-Sheet[4D]), 5V_FILT (see Top_Sheet[2A], I2S-to-SPDIF-Sheet[3D], Power-Sheet[4D]), GND (see Top_Sheet[2B], Controller-Sheet[2D], I2S-to-SPDIF-Sheet[3D], Power-Sheet[4D]), I2C (bidir, harness I2C, see Top_Sheet[3B], Controller-Sheet[2D], I2S-to-SPDIF-Sheet[2D]), I2S_INPUT (bidir, harness I2S_INPUT, see Top_Sheet[3B], Controller-Sheet[3D]), PCM1_COMMAND (bidir, harness PCM1_COMMAND, see Top_Sheet[3B], Controller-Sheet[5D])

### Harnesses
I2C: SCL, SDA
I2S_INPUT: IN_WS, IN_CK, IN_SD
PCM1_COMMAND: PCM1_ERROR/INT0, PCM1_NPCM/INT1, PCM_RST1

### Nets
3V3: C17.2 C24.2 C25.2 C26.2 C27.2 C67.2 C68.2 C69.2 U4.22(DVDD) U4.36(VDDRX) U4.42(VCC) U13.5(VCC) U14.2(B) U14.5(VCC) U15.8(VCC) ; port 3V3
5V: C18.2 C19.2 U4.46(VCCAD) ; port 5V
5V_FILT: L2.1 ; port 5V_FILT
GND: C17.1 C18.1 C19.1 C20.1 C21.1 C22.1 C23.1 C24.1 C25.1 C26.1 C27.1 C28.2 C29.2 C30.1 C31.1 C67.1 C68.1 C69.1 U4.21(DGND) U4.23(MDO/ADRO) U4.26(MS/ADR1) U4.27(MODE) U4.38(GNDRX) U4.41(AGND) U4.45(AGNDAD) U5.2(GND) U13.1(~{OE}) U13.3(GND) U14.3(GND) U15.1(1~{OE}) U15.4(GND) U15.7(2~{OE}) X1.2(GND) X1.4(GND) ; port GND
IN_CK: U15.3(2Y) ; port I2S_INPUT.IN_CK
IN_CK_BUFF: U4.19(BCK) U15.5(2A)
IN_SD: U4.17(DOUT) ; port I2S_INPUT.IN_SD
IN_WS: U15.6(1Y) ; port I2S_INPUT.IN_WS
IN_WS_BUFF: U4.18(LRCK) U15.2(1A)
OUT_Y: U13.2(A) U14.4(Y)
PCM1_ERROR/INT0: U4.1(ERROR/INTO) ; port PCM1_COMMAND.PCM1_ERROR/INT0
PCM1_NPCM/INT1: U4.2(NPCM/INT1) ; port PCM1_COMMAND.PCM1_NPCM/INT1
PCM_RST1: U4.34(RST) ; port PCM1_COMMAND.PCM_RST1
SCL: U4.25(MC/SCL) ; port I2C.SCL  [project net I2C.SCL]
SDA: U4.24(MDL/SDA) ; port I2C.SDA  [project net I2C.SDA]
SPDIF-IN: U5.3(VOUT) U14.1(A)
SPDIF-INN: U4.33(RXIN2) U13.4(Y)
XTI_1: C30.2 U4.39(XTI) X1.1(OSC1)
XTO_1: C31.2 U4.40(XTO) X1.3(OSC2)
NetC20_2: C20.2 C21.2 L2.2 U5.1(VCC)
NetC22_2: C22.2 C23.2 U4.44(VCOM)
NetC28_1: C28.1 R7.2
NetC29_1: C29.1 R7.1 U4.43(FLLT)

Not connected (* = marked no-connect by the designer): U4 3(MPIO_AO)* 4(MPIO_A1)* 5(MPIO_A2)* 6(MPIO_A3)* 7(MPIO_CO)* 8(MPIO_C1)* 9(MPIO_C2)* 10(MPIO_C3)* 11(MPIO_BO)* 12(MPIO_B1)* 13(MPIO_B2)* 14(MPIO_B3)* 15(MPOO)* 16(MPO1)* 20(SCKO)* 28(RXIN7/ADINO)* 29(RXIN6/ALRCKIO)* 30(RXIN5/ABCKIO)* 31(RXIN4/ASCKIO)* 32(RXIN3)* 35(RXIN1)* 37(RXINO)* 47(VINL)* 48(VINR)*; U5 4(NC)* 5(NC)*

### Layout directives
net class SPDIF: SPDIF-IN, SPDIF-INN

### Notes on the sheet
- (near U4) SPDIF to I2S
- (near U5) SPDIF INPUT
- I2C ADDRESS "1000000"
- (near U4) GND For I2C MODE
- INPUT BUFFER
- Pulled up at controller side
- OUTPUT BUFFER
- File:
- Title:
- Date:
- Page
- Num:
- Total:
- Drawn By: Huzaifa Ali

### Library data of the parts
C17 C19 C21 C23 C25 C27 C67-C69 = CC0402KRX7R8BB104: as C3 on sheet Power-Sheet; Supplier 1: Digi-Key; Manufacturer Part Number: CC0402KRX7R8BB104; RoHS: Yes; Category: Ceramic Capacitors; Stock 1: 1841009; Pricing 1: 1=0.10000, 10=0.03100, 50=0.01700, 100=0.01390, 500=0.00990, 1000=0.00777, 2500=0.00707, 5000=0.00650 (USD); Mount: Surface Mount; Case/Package: 0402; Case Code (Imperial): 0402; Case Code (Metric): 1005; Min Operating Temperature: -55°C; Max Operating Temperature: 125°C; Dielectric: X7R; Voltage Rating: 25V; Voltage Rating (DC): 25V; Packaging: Tape and Reel; Termination: SMD/SMT; Resistor Type: Ceramic; Length: 1mm; Width: 0.02inch; Height: 0.5mm; Thickness: 0.022inch; Depth: 0.5mm; Radiation Hardening: No; Lead Free: Lead Free; Halogen Free: Halogen Free; ComponentLink1URL: https://datasheet.ciiva.com/11464/upy-gphc-x7r-6-3v-to-50v-8-11464889.pdf?src-supplier=Avnet; ComponentLink1Description: https://datasheet.ciiva.com/11464/upy-gphc-x7r-6-3v-to-50v-8-11464889.pdf?src-supplier=Avnet; ComponentLink2URL: https://datasheet.ciiva.com/13210/upy-gphc-x7r-6-3v-to-50v-8-12304-13210908.pdf?src-supplier=Mouser; ComponentLink2Description: https://datasheet.ciiva.com/13210/upy-gphc-x7r-6-3v-to-50v-8-12304-13210908.pdf?src-supplier=Mouser; ComponentLink3URL: https://datasheet.ciiva.com/17437/upy-gphc-x7r-6-3v-to-50v-8-17437357.pdf?src-supplier=Avnet+Europe; ComponentLink3Description: https://datasheet.ciiva.com/17437/upy-gphc-x7r-6-3v-to-50v-8-17437357.pdf?src-supplier=Avnet+Europe; Supplier Part Number 1: 311-2077-1-ND; LCSC Part Number: C105883
C18 C20 C22 C24 C26 = CL05A106MP5NUNC: as C6 on sheet Power-Sheet; Supplier 1: Avnet; Manufacturer Part Number: CL05A106MP5NUNC; RoHS: Yes; Category: Ceramic Capacitors; Stock 1: 1729850; Pricing 1: 10000=0.02537 (USD); Mount: Surface Mount; Case/Package: 0402; Case Code (Metric): 1005; Case Code (Imperial): 0402; Contact Plating: Tin; Min Operating Temperature: -55°C; Max Operating Temperature: 85°C; Package Quantity: 1; Packaging: Tape and Reel; Capacitance: 10uF; Voltage Rating: 10V; Dielectric: X5R; Termination: Wraparound; Series: CL; Construction: Flat; Length: 1mm; Width: 0.02inch; Thickness: 0.028inch; Depth: 0.5mm; Radiation Hardening: No; Lead Free: Lead Free; RoHS Compliant: Yes; ComponentLink1URL: https://datasheet.ciiva.com/25721/cl05a106mp5nunc-25721584.pdf?src-supplier=Digi-Key; ComponentLink1Description: https://datasheet.ciiva.com/25721/cl05a106mp5nunc-25721584.pdf?src-supplier=Digi-Key; ComponentLink2URL: https://datasheet.ciiva.com/26838/getdatasheetpartid-745310-26838170.pdf?src-supplier=Verical; ComponentLink2Description: https://datasheet.ciiva.com/26838/getdatasheetpartid-745310-26838170.pdf?src-supplier=Verical; Supplier Part Number 1: CL05A106MP5NUNC; LCSC Part Number: C315248
C28 = CC0402KRX7R9BB683: CAP CER 0.068UF 50V X7R 0402; Manufacturer: Yageo; Dielectric: 1511DielectricType; Item Type: Capacitor; Supplier 1: Future Electronics; Manufacturer Part Number: CC0402KRX7R9BB683; RoHS: Yes; Category: Ceramic Capacitors; Stock 1: 100000; Pricing 1: 10000=0.0035, 40000=0.0033, 100000=0.0032, 250000=0.0031, 400000=0.0029 (USD); Case/Package: 343Case; Capacitance: 68nF; Voltage Rating (DC): 50V; Halogen Free: 5694HalogenFree; Lead Free: 5697LeadFree; Supplier Part Number 1: 2106471
C29 = CC0402KRX7R9BB472: CAP CER 4700PF 50V X7R 0402; Manufacturer: Yageo; Material: 4241ConductorMaterial; Tolerance: 10%; Temperature Coefficient: 30ppm/°C; Item Type: Capacitor; Supplier 1: Future Electronics; Manufacturer Part Number: CC0402KRX7R9BB472; RoHS: Yes; Category: Ceramic Capacitors; Stock 1: 1780000; Pricing 1: 10000=0.0021, 40000=0.002, 150000=0.0019, 400000=0.0018, 1000000=0.0017 (USD); Mount: Surface Mount; Case/Package: 0402; Number of Pins: 2NUMBER; Case Code (Imperial): 0402; Case Code (Metric): 1005; Min Operating Temperature: -55°C; Max Operating Temperature: 125°C; Capacitance: 4.7nF; Dielectric: X7R; Voltage Rating: 50V; Voltage Rating (DC): 50V; Packaging: Tape and Reel; Package Quantity: 1; Termination: SMD/SMT; Series: CC; Construction: Flat; Length: 1mm; Width: 0.02inch; Height: 0.5mm; Thickness: 0.022inch; Depth: 0.5mm; Radiation Hardening: No; Reach SVHC Compliant: No; RoHS Compliant: Yes; Halogen Free: 5694HalogenFree; Lead Free: 5697LeadFree; ComponentLink1URL: https://datasheet.ciiva.com/7978/1489800-7978108.pdf?src-supplier=Element14; ComponentLink1Description: https://datasheet.ciiva.com/7978/1489800-7978108.pdf?src-supplier=Element14; ComponentLink2URL: https://datasheet.ciiva.com/176/mlccorderingcode-176364.pdf?src-supplier=Digikey; ComponentLink2Description: https://datasheet.ciiva.com/176/mlccorderingcode-176364.pdf?src-supplier=Digikey; ComponentLink3URL: https://datasheet.ciiva.com/176/mlccorderingcode-176363.pdf?src-supplier=Digikey; ComponentLink3Description: https://datasheet.ciiva.com/176/mlccorderingcode-176363.pdf?src-supplier=Digikey; ComponentLink4URL: https://datasheet.ciiva.com/176/mlccorderingcode-176365.pdf?src-supplier=Digikey; ComponentLink4Description: https://datasheet.ciiva.com/176/mlccorderingcode-176365.pdf?src-supplier=Digikey; ComponentLink5URL: https://datasheet.ciiva.com/11586/upy-gphc-x7r-6-3v-to-50v-8-11586491.pdf?src-supplier=Avnet; ComponentLink5Description: https://datasheet.ciiva.com/11586/upy-gphc-x7r-6-3v-to-50v-8-11586491.pdf?src-supplier=Avnet; Supplier Part Number 1: 1989300
C30 C31 = GCM1555C1H180GA16D: CAP CER 18PF 50V C0G/NP0 0402; Manufacturer: Murata; Tolerance: 2%; Item Type: Capacitor; Supplier: Rs; Supplier Part Number: 2477793P; Manufacturer Part Number: GCM1555C1H180GA16D; RoHS: Yes; Category: Ceramic Capacitors; Stock: 10000; Pricing: 500=0.013, 5000=0.009 (GBP); Mounting Technology: Surface Mount; Case/Package: 0402; Case Code (Imperial): 0402; Case Code (Metric): 1005; Min Operating Temperature: -55°C; Max Operating Temperature: 125°C; Packaging: Cut Tape; Value: 18pF; Voltage Rating: 50V; Series: GCM; Ratings: AEC-Q200; RoHS Compliant: Yes; ComponentLink1URL: http://search.murata.co.jp/Ceramy/image/img/A01X/G101/ENG/GCM1555C1H180GA16-01.pdf?src-supplier=Digi-Key; ComponentLink1Description: http://search.murata.co.jp/Ceramy/image/img/A01X/G101/ENG/GCM1555C1H180GA16-01.pdf?src-supplier=Digi-Key; ComponentLink2URL: https://search.murata.co.jp/Ceramy/image/img/A01X/G101/ENG/GCM1555C1H180GA16-01.pdf?src-supplier=Digi-Key; ComponentLink2Description: https://search.murata.co.jp/Ceramy/image/img/A01X/G101/ENG/GCM1555C1H180GA16-01.pdf?src-supplier=Digi-Key; ComponentLink3URL: https://datasheet.octopart.com/GCM1555C1H180GA16D-Murata-datasheet-149522315.pdf?src-supplier=Newark; ComponentLink3Description: https://datasheet.octopart.com/GCM1555C1H180GA16D-Murata-datasheet-149522315.pdf?src-supplier=Newark; ComponentLink4URL: https://datasheet.octopart.com/GCM1555C1H180GA16D-Murata-datasheet-12511495.pdf?src-supplier=TME; ComponentLink4Description: https://datasheet.octopart.com/GCM1555C1H180GA16D-Murata-datasheet-12511495.pdf?src-supplier=TME; LCSC Part Number: C882583
L2 = MLW2012RF-470MT: 280mA 47uH ±20% 3.4Ω 0805 Inductors (SMD) ROHS; Manufacturer: MetalLions; Manufacturer Part Number: MLW2012RF-470MT; Package: 0805; LCSC Part Number: C2844637; Item Type: Inductor; ComponentLink1Description: LCSC; ComponentLink1URL: https://www.lcsc.com/product-detail/Inductors-SMD_MetalLions-MLW2012RF-470MT_C2844637.html
R7 = RC0402FR-07680RL: RES 680 OHM 1% 1/16W 0402; Manufacturer: Yageo; Temperature Coefficient: 100ppm/°C; Power Rating: 63mW; Voltage Rating: 50V; Item Type: Resistor; Supplier 1: Future Electronics; Manufacturer Part Number: RC0402FR-07680RL; RoHS: Yes; Category: Chip SMD Resistors; Stock 1: 5080000; Pricing 1: 10000=0.0011, 100000=0.0011, 300000=0.001, 750000=0.001, 2000000=0.0009 (USD); Case/Package: 0402; Case Code (Imperial): 0402; Case Code (Metric): 1005; Size Code: 0402; Min Operating Temperature: -55°C; Max Operating Temperature: 155°C; Resistance: 680R; Tolerance: 1%; Packaging: Tape and Reel; Resistor Type: Thick Film; Termination: SMD/SMT; Features: Moisture Resistant; Series: RC; Max Power Dissipation: 63mW; Number of Terminations: 2; Resistance Tolerance: 1%; Construction: Rectangular; Voltage Rating (AC): 50V; Length: 1mm; Depth: 0.5mm; Reach SVHC Compliant: No; Lead Free: Lead Free; Military Standard: Not; RoHS Compliant: Yes; ComponentLink1URL: https://datasheet.ciiva.com/12667/pyu-rc0402-51-rohs-l-6-r-12667916.pdf?src-supplier=Mouser; ComponentLink1Description: https://datasheet.ciiva.com/12667/pyu-rc0402-51-rohs-l-6-r-12667916.pdf?src-supplier=Mouser; ComponentLink2URL: https://datasheet.ciiva.com/7850/1018594-7850071.pdf?src-supplier=Element14; ComponentLink2Description: https://datasheet.ciiva.com/7850/1018594-7850071.pdf?src-supplier=Element14; ComponentLink3URL: https://datasheet.ciiva.com/7850/1018594-7850070.pdf?src-supplier=Element14; ComponentLink3Description: https://datasheet.ciiva.com/7850/1018594-7850070.pdf?src-supplier=Element14; ComponentLink4URL: https://datasheet.ciiva.com/17042/pyu-rc0402-51-rohs-l-6-r-17042399.pdf?src-supplier=Future+Electronics; ComponentLink4Description: https://datasheet.ciiva.com/17042/pyu-rc0402-51-rohs-l-6-r-17042399.pdf?src-supplier=Future+Electronics; Supplier Part Number 1: 7948052
U4 = PCM9211PTR: IC AUDIO TRANSCEIVER 48LQFP; Manufacturer: Texas Instruments; Item Type: Amplifiers - Audio; Supplier: Mouser; Supplier Part Number: 595-PCM9211PTR; Manufacturer Part Number: PCM9211PTR; RoHS: Yes; Stock: 2280; Pricing: 1=3.06, 10=2.74, 50=2.74, 100=2.51, 1000=1.8, 10000=1.49 (USD); ComponentLink1URL: https://datasheet.ciiva.com/1825/pcm9211-1825949.pdf?src-supplier=Digikey; ComponentLink1Description: https://datasheet.ciiva.com/1825/pcm9211-1825949.pdf?src-supplier=Digikey; ComponentLink2URL: https://datasheet.ciiva.com/3026/sbas495-3026720.pdf?src-supplier=Avnet; ComponentLink2Description: https://datasheet.ciiva.com/3026/sbas495-3026720.pdf?src-supplier=Avnet; ComponentLink3URL: https://datasheet.ciiva.com/1825/pcm9211-1825950.pdf?src-supplier=Digikey; ComponentLink3Description: https://datasheet.ciiva.com/1825/pcm9211-1825950.pdf?src-supplier=Digikey; ComponentLink4URL: https://datasheet.ciiva.com/1825/pcm9211-1825951.pdf?src-supplier=Digikey; ComponentLink4Description: https://datasheet.ciiva.com/1825/pcm9211-1825951.pdf?src-supplier=Digikey
U5 = PLR237/T10BK: FIBER OPTIC RECEIVER IR; Manufacturer: Everlight; Supplier: Digikey; Supplier Part Number: 1080-PLR237/T10BK-ND; Manufacturer Part Number: PLR237/T10BK; RoHS: No; Item Type: FIBER OPTIC RECEIVER; Stock: 4654; Pricing: 1=3.86, 60=2.727, 120=2.2335, 540=1.88291, 1020=1.72708, 2040=1.65566, 5040=1.6232 (USD); LCSC Part Number: C17427482
U13 = SN74LVC1G125DBVR: IC BUFF NON-INVERT 5.5V SOT23-5; Manufacturer: Texas Instruments; Item Type: Buffers, Drivers and Transceivers; Number of Elements: 1; Logic Function: Buffer,Inverting; High Level Output Current: 32mA; Polarity: Non-Inverting; Output Type: 3-STATE; Min Supply Voltage: 1.65V; Propagation Delay: 4ns; Quiescent Current: 10uA; Supplier 1: Mouser; Manufacturer Part Number: SN74LVC1G125DBVR; RoHS: Yes; Stock 1: 237997; Pricing 1: 1=0.36, 10=0.243, 50=0.243, 100=0.102, 1000=0.07, 10000=0.037 (USD); Mount: Surface Mount; Case/Package: SOT-23-5; Weight: 0.001446oz; Min Operating Temperature: -40°C; Max Operating Temperature: 125°C; Packaging: Tape and Reel; Package Quantity: 3000; Number of Bits per Element: 1; Low Level Output Current: 32mA; Number of Gates: 1; Number of Bits: 1; Series: 74LVC; Max Supply Voltage: 5.5V; Number of Channels: 1; Technology: CMOS; Number of Input Lines: 1; Number of Output Lines: 1; Number of Circuits: 1; Max Supply Current: 10uA; Length: 2.9mm; Width: 1.6mm; Height: 1.15mm; Lead Free: Lead Free; RoHS Compliant: Yes; Supplier Part Number 1: 595-SN74LVC1G125DBVR
U14 = SN74LVC1G08DCKR: IC GATE AND 1CH 2-INP SC70-5; Manufacturer: Texas Instruments; Item Type: Logic Gates; Propagation Delay: 4ns; Number of Gates: 1; Logic Function: AND GATE; Min Supply Voltage: 1.65V; Max Supply Voltage: 5.5V; Output Current: 32mA; Number of Inputs: 2; Quiescent Current: 10uA; High Level Output Current: -32mA; Turn-On Delay Time: 4.5ns; Number of Channels: 1NUMBER; Schmitt Trigger Input: No; Supplier 1: Mouser; Manufacturer Part Number: SN74LVC1G08DCKR; RoHS: Yes; Stock 1: 509262; Pricing 1: 1=0.33, 10=0.228, 50=0.228, 100=0.095, 1000=0.065, 10000=0.035 (USD); Mount: Surface Mount; Case/Package: SC; Number of Pins: 5; Weight: 8.8E-05oz; Min Operating Temperature: -40°C; Max Operating Temperature: 125°C; Packaging: Tape and Reel; Number of Bits: 1; Number of Outputs: 1; Number of Input Lines: 2; Number of Output Lines: 1; Low Level Output Current: 32mA; Number of Circuits: 1; Number of Elements: 1; Series: 74LVC; Technology: CMOS; Max Output Current: 32mA; Termination: SMD/SMT; Length: 2.15mm; Width: 1.4mm; Height: 1mm; Thickness: 900um; Radiation Hardening: No; Reach SVHC Compliant: No; Lead Free: Lead Free; RoHS Compliant: Yes; ComponentLink1URL: https://datasheet.ciiva.com/14290/sn74lvc1g08-14290720.pdf?src-supplier=Avnet; ComponentLink1Description: https://datasheet.ciiva.com/14290/sn74lvc1g08-14290720.pdf?src-supplier=Avnet; ComponentLink2URL: https://datasheet.ciiva.com/28540/1772545-28540798.pdf?src-supplier=Element14; ComponentLink2Description: https://datasheet.ciiva.com/28540/1772545-28540798.pdf?src-supplier=Element14; ComponentLink3URL: https://datasheet.ciiva.com/1864/sn74lvc1g08-1864342.pdf?src-supplier=Digikey; ComponentLink3Description: https://datasheet.ciiva.com/1864/sn74lvc1g08-1864342.pdf?src-supplier=Digikey; ComponentLink4URL: https://datasheet.ciiva.com/1864/sn74lvc1g08-1864341.pdf?src-supplier=Digikey; ComponentLink4Description: https://datasheet.ciiva.com/1864/sn74lvc1g08-1864341.pdf?src-supplier=Digikey; ComponentLink5URL: https://datasheet.ciiva.com/1864/sn74lvc1g08-1864343.pdf?src-supplier=Digikey; ComponentLink5Description: https://datasheet.ciiva.com/1864/sn74lvc1g08-1864343.pdf?src-supplier=Digikey; ComponentLink6URL: https://datasheet.ciiva.com/14290/sn74lvc1g08-14290717.pdf?src-supplier=Avnet; ComponentLink6Description: https://datasheet.ciiva.com/14290/sn74lvc1g08-14290717.pdf?src-supplier=Avnet; Supplier Part Number 1: 595-SN74LVC1G08DCKR; LCSC Part Number: C7832
U15 = SN74LVC2G125DCTR: IC BUFFER NON-INVERT 5.5V SM8; Manufacturer: Texas Instruments; Nominal Supply Current: 10uA; Number of Circuits: 1NUMBER; Supplier 1: Mouser; Manufacturer Part Number: SN74LVC2G125DCTR; RoHS: Yes; Item Type: IC; Stock 1: 14743; Pricing 1: 1=0.52, 10=0.427, 50=0.427, 100=0.316, 1000=0.241, 10000=0.19 (USD); Thickness: 1.29mm; ComponentLink1URL: https://datasheet.ciiva.com/7744/1781747-7744021.pdf?src-supplier=Element14; ComponentLink1Description: https://datasheet.ciiva.com/7744/1781747-7744021.pdf?src-supplier=Element14; ComponentLink2URL: https://datasheet.ciiva.com/7744/1781747-7744022.pdf?src-supplier=Element14; ComponentLink2Description: https://datasheet.ciiva.com/7744/1781747-7744022.pdf?src-supplier=Element14; Supplier Part Number 1: 595-SN74LVC2G125DCTR; LCSC Part Number: C206035
X1 = S3224576121060: 24.576MHz SMD Crystal Resonator 12pF 60Ω ±10ppm -40℃~+85℃ SMD3225-4P Crystals ROHS; Manufacturer: JGHC; Manufacturer Part Number: S3224576121060; Footprint: Custom; ComponentLink1Description: LCSC; ComponentLink1URL: https://lcsc.com/product-detail/Crystals_JGHC-S3224576121060_C390772.html; Value: 24.576MHz; LCSC Part Number: C390772

## Nets that join several sheets
3V3: Controller-Sheet (46 pins), I2S-to-SPDIF-Sheet (9 pins), Power-Sheet (C9.2 U2.4), SPDIF-to-I2S-Sheet (15 pins)
5V: I2S-to-SPDIF-Sheet (C47.2 C48.2 U7.46), Power-Sheet (8 pins), SPDIF-to-I2S-Sheet (C18.2 C19.2 U4.46)
5V_FILT: I2S-to-SPDIF-Sheet (15 pins), Power-Sheet (C14.2 C15.2 U3.9 U3.10), SPDIF-to-I2S-Sheet (L2.1)
GND: Controller-Sheet (50 pins), I2S-to-SPDIF-Sheet (39 pins), Power-Sheet (28 pins), SPDIF-to-I2S-Sheet (34 pins)
A0: Controller-Sheet (U6.33), I2S-to-SPDIF-Sheet (R41.2 U10.1)
A1: Controller-Sheet (U6.34), I2S-to-SPDIF-Sheet (R40.2 U10.10)
I2C.SCL: Controller-Sheet (R22.2 U6.58), I2S-to-SPDIF-Sheet (U7.25), SPDIF-to-I2S-Sheet (U4.25)
I2C.SDA: Controller-Sheet (R23.2 U6.59), I2S-to-SPDIF-Sheet (U7.24), SPDIF-to-I2S-Sheet (U4.24)
IN_CK: Controller-Sheet (U6.29), SPDIF-to-I2S-Sheet (U15.3)
IN_SD: Controller-Sheet (U6.36), SPDIF-to-I2S-Sheet (U4.17)
IN_WS: Controller-Sheet (U6.62), SPDIF-to-I2S-Sheet (U15.6)
OUT_CK: Controller-Sheet (U6.55), I2S-to-SPDIF-Sheet (U7.8)
OUT_MCK: Controller-Sheet (U6.38), I2S-to-SPDIF-Sheet (U7.7)
OUT_SD: Controller-Sheet (U6.57), I2S-to-SPDIF-Sheet (U7.10)
OUT_WS: Controller-Sheet (U6.20), I2S-to-SPDIF-Sheet (U7.9)
PCM1_ERROR/INT0: Controller-Sheet (U6.53), SPDIF-to-I2S-Sheet (U4.1)
PCM1_NPCM/INT1: Controller-Sheet (U6.2), SPDIF-to-I2S-Sheet (U4.2)
PCM2_ERROR/INT0: Controller-Sheet (U6.61), I2S-to-SPDIF-Sheet (U7.1)
PCM2_NPCM/INT1: Controller-Sheet (U6.35), I2S-to-SPDIF-Sheet (U7.2)
PCM_RST1: Controller-Sheet (R15.2 U6.50), SPDIF-to-I2S-Sheet (U4.34)
PCM_RST2: Controller-Sheet (R19.2 U6.54), I2S-to-SPDIF-Sheet (U7.34)